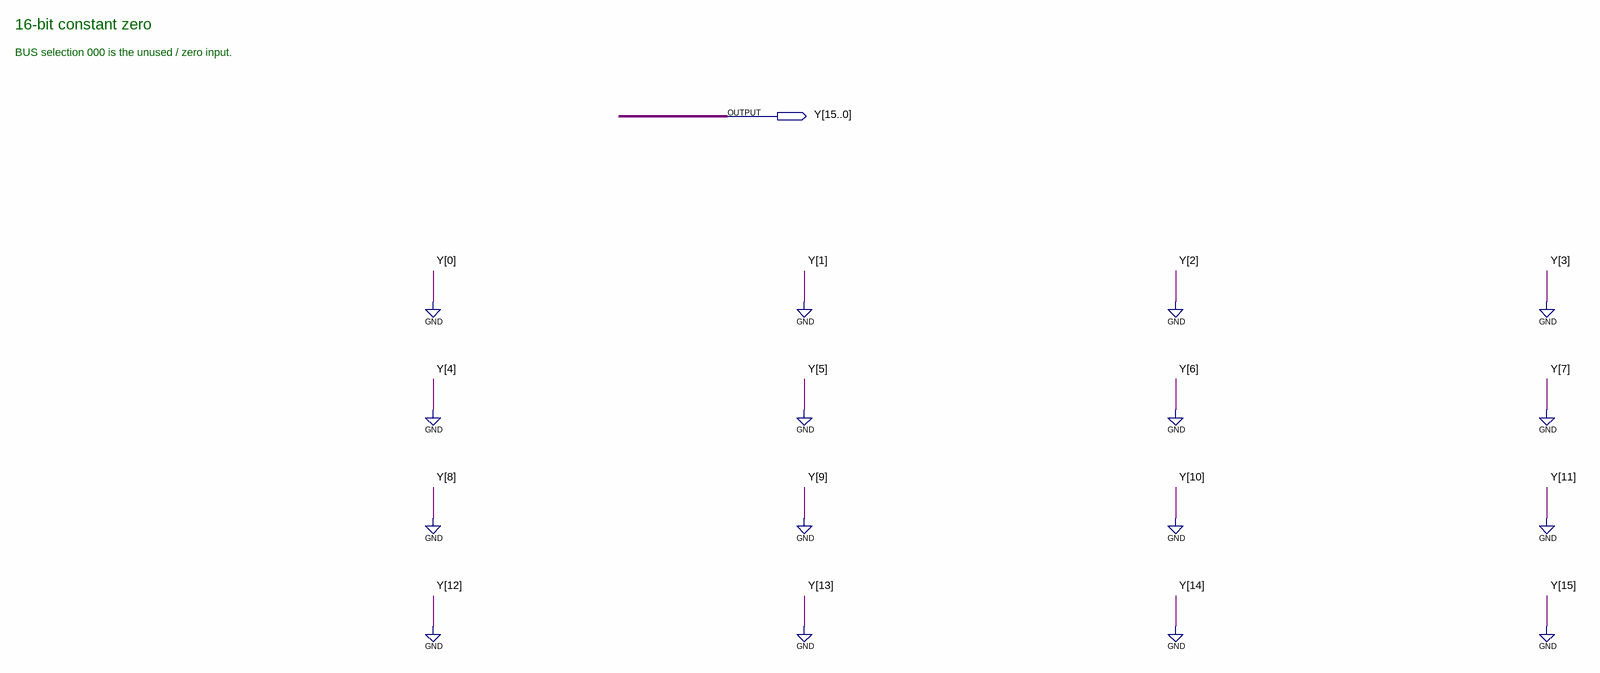
[diagram p0: schematic sheet]
// Quartus schematic zero16.bdf as structural Verilog: 0 symbols, 1 pins
module zero16 (
  output [15:0] Y
);


  assign Y = {16{1'b0}};

  // Notes on the sheet:
  //   16-bit constant zero
  //   BUS selection 000 is the unused / zero input.
endmodule
